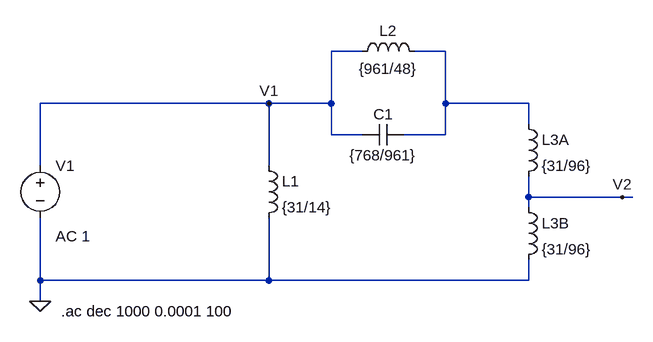
[diagram p0: schematic punto3_circuito_cuadripolos.asc]
punto3_circuito_cuadripolos.asc, the LTspice schematic file:
Version 4
SHEET 1 1480 1040
WIRE 576 -64 528 -64
WIRE 704 -64 656 -64
WIRE 432 16 80 16
WIRE 528 16 528 -64
WIRE 528 16 432 16
WIRE 704 16 704 -64
WIRE 832 16 704 16
WIRE 832 48 832 16
WIRE 528 64 528 16
WIRE 576 64 528 64
WIRE 704 64 704 16
WIRE 704 64 640 64
WIRE 80 112 80 16
WIRE 432 112 432 16
WIRE 832 160 832 128
WIRE 976 160 832 160
WIRE 992 160 976 160
WIRE 832 176 832 160
WIRE 80 288 80 192
WIRE 432 288 432 192
WIRE 432 288 80 288
WIRE 832 288 832 256
WIRE 832 288 432 288
WIRE 80 320 80 288
FLAG 80 320 0
FLAG 432 16 V1
FLAG 976 160 V2
SYMBOL ind 416 96 R0
SYMATTR InstName L1
SYMATTR Value {31/14}
SYMATTR SpiceLine Rser=1n
SYMBOL ind 560 -48 R270
WINDOW 0 32 56 VTop 2
WINDOW 3 5 56 VBottom 2
SYMATTR InstName L2
SYMATTR Value {961/48}
SYMATTR SpiceLine Rser=0
SYMBOL cap 640 48 R90
WINDOW 0 0 32 VBottom 2
WINDOW 3 32 32 VTop 2
SYMATTR InstName C1
SYMATTR Value {768/961}
SYMBOL ind 816 32 R0
SYMATTR InstName L3A
SYMATTR Value {31/96}
SYMATTR SpiceLine Rser=0
SYMBOL ind 816 160 R0
SYMATTR InstName L3B
SYMATTR Value {31/96}
SYMATTR SpiceLine Rser=0
SYMBOL voltage 80 96 R0
WINDOW 123 24 124 Left 2
WINDOW 39 0 0 Left 0
SYMATTR InstName V1
SYMATTR Value ""
SYMATTR Value2 AC 1
TEXT 112 336 Left 2 !.ac dec 1000 0.0001 100

The netlist it stands for:
* punto3_circuito_cuadripolos.asc
L1 V1 0 {31/14} Rser=1n
L2 V1 N001 {961/48} Rser=0
C1 N001 V1 {768/961}
L3A N001 V2 {31/96} Rser=0
L3B V2 0 {31/96} Rser=0
V1 V1 0 AC 1
.ac dec 1000 0.0001 100
.backanno
.end